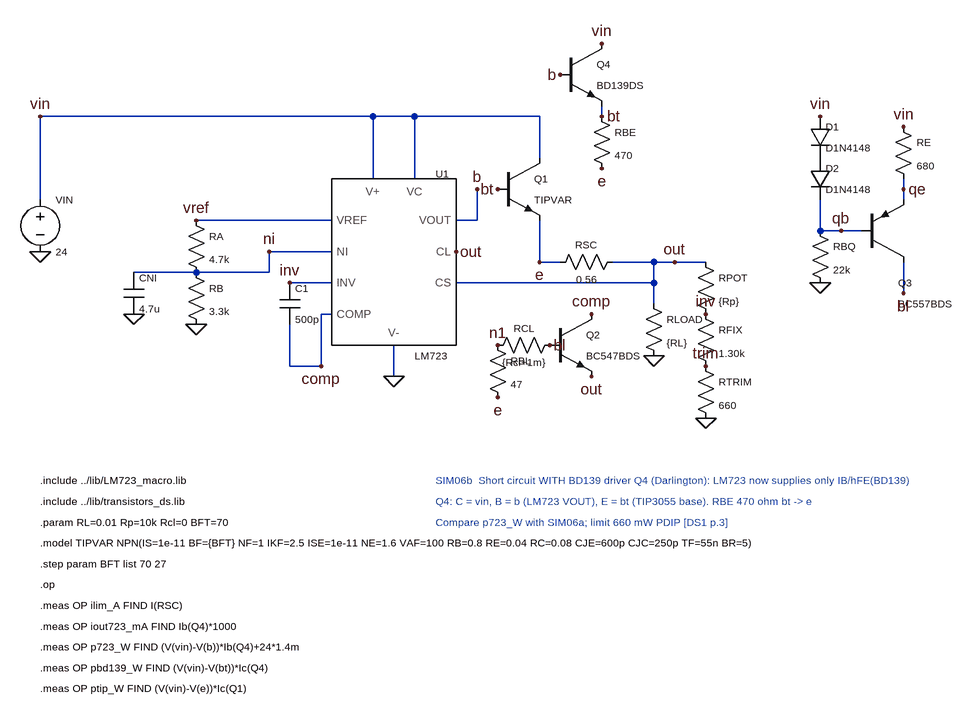
[diagram p0: schematic SIM06b_short_bd139_driver.asc]
SIM06b_short_bd139_driver.asc, the LTspice schematic file:
Version 4
SHEET 1 1700 1150
WIRE 96 304 96 176
WIRE 960 160 960 176
WIRE 96 176 864 176
WIRE 608 176 608 272
WIRE 672 176 672 272
WIRE 864 176 864 240
WIRE 640 528 640 576
WIRE 544 336 336 336
WIRE 336 416 448 416
WIRE 448 416 448 384
WIRE 448 384 544 384
WIRE 240 416 336 416
WIRE 544 432 480 432
WIRE 544 480 528 480
WIRE 528 480 528 560
WIRE 528 560 480 560
WIRE 480 560 480 496
WIRE 736 336 768 336
WIRE 768 336 768 288
WIRE 864 336 864 400
WIRE 864 400 896 400
WIRE 976 400 1120 400
WIRE 736 432 1040 432
WIRE 1040 432 1040 400
WIRE 1040 432 1040 464
WIRE 1296 304 1296 352
WIRE 1296 352 1360 352
WIRE 1424 272 1424 304
WIRE 1424 400 1424 448
FLAG 96 384 0
FLAG 640 576 0
FLAG 336 496 0
FLAG 240 480 0
FLAG 96 176 vin
FLAG 336 336 vref
FLAG 448 384 ni
FLAG 480 432 inv
FLAG 528 560 comp
FLAG 768 288 b
FLAG 800 288 bt
FLAG 960 64 vin
FLAG 896 112 b
FLAG 960 176 bt
FLAG 960 256 e
FLAG 736 384 out
FLAG 864 400 e
FLAG 1072 400 out
FLAG 1040 544 0
FLAG 944 480 comp
FLAG 944 576 out
FLAG 880 528 bl
FLAG 800 528 n1
FLAG 800 608 e
FLAG 1296 176 vin
FLAG 1424 192 vin
FLAG 1296 432 0
FLAG 1424 448 bl
FLAG 1328 352 qb
FLAG 1424 288 qe
FLAG 1120 480 inv
FLAG 1120 560 trim
FLAG 1120 640 0
SYMBOL voltage 96 288 R0
WINDOW 0 24 16 Left 1
WINDOW 3 24 96 Left 1
SYMATTR InstName VIN
SYMATTR Value 24
SYMBOL LM723 640 400 R0
WINDOW 0 64 -136 Left 1
WINDOW 3 32 144 Left 1
SYMATTR InstName U1
SYMBOL npn 896 64 R0
WINDOW 0 56 32 Left 1
WINDOW 3 56 64 Left 1
SYMATTR InstName Q4
SYMATTR Value BD139DS
SYMBOL res 944 160 R0
WINDOW 0 36 40 Left 1
WINDOW 3 36 76 Left 1
SYMATTR InstName RBE
SYMATTR Value 470
SYMBOL npn 800 240 R0
WINDOW 0 56 32 Left 1
WINDOW 3 56 64 Left 1
SYMATTR InstName Q1
SYMATTR Value TIPVAR
SYMBOL res 320 320 R0
WINDOW 0 36 40 Left 1
WINDOW 3 36 76 Left 1
SYMATTR InstName RA
SYMATTR Value 4.7k
SYMBOL res 320 400 R0
WINDOW 0 36 40 Left 1
WINDOW 3 36 76 Left 1
SYMATTR InstName RB
SYMATTR Value 3.3k
SYMBOL cap 224 416 R0
WINDOW 0 24 8 Left 1
WINDOW 3 24 56 Left 1
SYMATTR InstName CNI
SYMATTR Value 4.7u
SYMBOL cap 464 432 R0
WINDOW 0 24 8 Left 1
WINDOW 3 24 56 Left 1
SYMATTR InstName C1
SYMATTR Value 500p
SYMBOL res 992 384 R90
WINDOW 0 0 56 VBottom 1
WINDOW 3 32 56 VTop 1
SYMATTR InstName RSC
SYMATTR Value 0.56
SYMBOL res 1024 448 R0
WINDOW 0 36 40 Left 1
WINDOW 3 36 76 Left 1
SYMATTR InstName RLOAD
SYMATTR Value {RL}
SYMBOL npn 880 480 R0
WINDOW 0 56 32 Left 1
WINDOW 3 56 64 Left 1
SYMATTR InstName Q2
SYMATTR Value BC547BDS
SYMBOL res 896 512 R90
WINDOW 0 0 56 VBottom 1
WINDOW 3 32 56 VTop 1
SYMATTR InstName RCL
SYMATTR Value {Rcl+1m}
SYMBOL res 784 512 R0
WINDOW 0 36 40 Left 1
WINDOW 3 36 76 Left 1
SYMATTR InstName RBL
SYMATTR Value 47
SYMBOL diode 1280 176 R0
WINDOW 0 24 16 Left 1
WINDOW 3 24 48 Left 1
SYMATTR InstName D1
SYMATTR Value D1N4148
SYMBOL diode 1280 240 R0
WINDOW 0 24 16 Left 1
WINDOW 3 24 48 Left 1
SYMATTR InstName D2
SYMATTR Value D1N4148
SYMBOL res 1280 336 R0
WINDOW 0 36 40 Left 1
WINDOW 3 36 76 Left 1
SYMATTR InstName RBQ
SYMATTR Value 22k
SYMBOL res 1408 176 R0
WINDOW 0 36 40 Left 1
WINDOW 3 36 76 Left 1
SYMATTR InstName RE
SYMATTR Value 680
SYMBOL pnp 1360 400 M180
WINDOW 0 56 -32 Left 1
WINDOW 3 56 -64 Left 1
SYMATTR InstName Q3
SYMATTR Value BC557BDS
SYMBOL res 1104 384 R0
WINDOW 0 36 40 Left 1
WINDOW 3 36 76 Left 1
SYMATTR InstName RPOT
SYMATTR Value {Rp}
SYMBOL res 1104 464 R0
WINDOW 0 36 40 Left 1
WINDOW 3 36 76 Left 1
SYMATTR InstName RFIX
SYMATTR Value 1.30k
SYMBOL res 1104 544 R0
WINDOW 0 36 40 Left 1
WINDOW 3 36 76 Left 1
SYMATTR InstName RTRIM
SYMATTR Value 660
TEXT 96 736 Left 1 !.include ../lib/LM723_macro.lib
TEXT 96 768 Left 1 !.include ../lib/transistors_ds.lib
TEXT 96 800 Left 1 !.param RL=0.01 Rp=10k Rcl=0 BFT=70
TEXT 96 832 Left 1 !.model TIPVAR NPN(IS=1e-11 BF={BFT} NF=1 IKF=2.5 ISE=1e-11 NE=1.6 VAF=100 RB=0.8 RE=0.04 RC=0.08 CJE=600p CJC=250p TF=55n BR=5)
TEXT 96 864 Left 1 !.step param BFT list 70 27
TEXT 96 896 Left 1 !.op
TEXT 96 928 Left 1 !.meas OP ilim_A FIND I(RSC)
TEXT 96 960 Left 1 !.meas OP iout723_mA FIND Ib(Q4)*1000
TEXT 96 992 Left 1 !.meas OP p723_W FIND (V(vin)-V(b))*Ib(Q4)+24*1.4m
TEXT 96 1024 Left 1 !.meas OP pbd139_W FIND (V(vin)-V(bt))*Ic(Q4)
TEXT 96 1056 Left 1 !.meas OP ptip_W FIND (V(vin)-V(e))*Ic(Q1)
TEXT 704 736 Left 1 ;SIM06b  Short circuit WITH BD139 driver Q4 (Darlington): LM723 now supplies only IB/hFE(BD139)
TEXT 704 768 Left 1 ;Q4: C = vin, B = b (LM723 VOUT), E = bt (TIP3055 base). RBE 470 ohm bt -> e
TEXT 704 800 Left 1 ;Compare p723_W with SIM06a; limit 660 mW PDIP [DS1 p.3]

The netlist it stands for:
* SIM06b_short_bd139_driver.asc
VIN vin 0 24
XU1 vin 0 vin b vref ni inv comp out out LM723  ; pins V+ V- VC VOUT VREF NI INV COMP CL CS
Q4 vin b bt 0 BD139DS
RBE bt e 470
Q1 vin bt e 0 TIPVAR
RA vref ni 4.7k
RB ni 0 3.3k
CNI ni 0 4.7u
C1 inv comp 500p
RSC out e 0.56
RLOAD out 0 {RL}
Q2 comp bl out 0 BC547BDS
RCL bl n1 {Rcl+1m}
RBL n1 e 47
D1 vin P001 D1N4148
D2 P001 qb D1N4148
RBQ qb 0 22k
RE vin qe 680
Q3 bl qb qe 0 BC557BDS
RPOT out inv {Rp}
RFIX inv trim 1.30k
RTRIM trim 0 660
.model D D
.lib standard.dio
.model NPN NPN
.model PNP PNP
.lib standard.bjt
.include ../lib/LM723_macro.lib
.include ../lib/transistors_ds.lib
.param RL=0.01 Rp=10k Rcl=0 BFT=70
.model TIPVAR NPN(IS=1e-11 BF={BFT} NF=1 IKF=2.5 ISE=1e-11 NE=1.6 VAF=100 RB=0.8 RE=0.04 RC=0.08 CJE=600p CJC=250p TF=55n BR=5)
.step param BFT list 70 27
.op
.meas OP ilim_A FIND I(RSC)
.meas OP iout723_mA FIND Ib(Q4)*1000
.meas OP p723_W FIND (V(vin)-V(b))*Ib(Q4)+24*1.4m
.meas OP pbd139_W FIND (V(vin)-V(bt))*Ic(Q4)
.meas OP ptip_W FIND (V(vin)-V(e))*Ic(Q1)
* SIM06b  Short circuit WITH BD139 driver Q4 (Darlington): LM723 now supplies only IB/hFE(BD139)
* Q4: C = vin, B = b (LM723 VOUT), E = bt (TIP3055 base). RBE 470 ohm bt -> e
* Compare p723_W with SIM06a; limit 660 mW PDIP [DS1 p.3]
.backanno
.end